# Altium schematic sheet Top-Sheet.SchDoc
size 420 x 297 mm; SheetNumber: 1; SheetTotal: 7
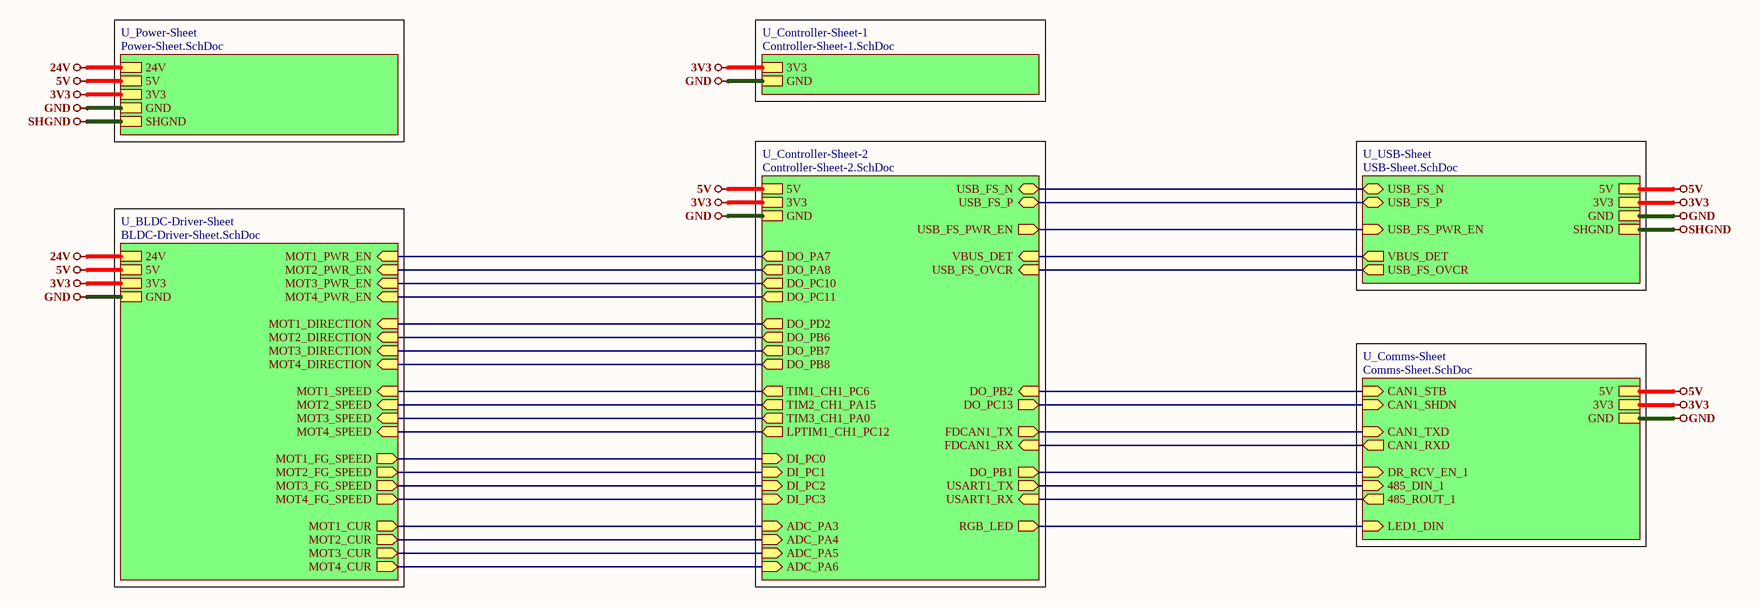
[diagram p0: Top-Sheet.SchDoc]

## Sub-sheets
U_BLDC-Driver-Sheet = BLDC-Driver-Sheet.SchDoc: GND, 3V3, 5V, 24V, MOT1_DIRECTION (in), MOT2_DIRECTION (in), MOT3_DIRECTION (in), MOT4_DIRECTION (in), MOT1_SPEED (in), MOT2_SPEED (in), MOT3_SPEED (in), MOT4_SPEED (in), MOT1_FG_SPEED (out), MOT2_FG_SPEED (out), MOT3_FG_SPEED (out), MOT4_FG_SPEED (out), MOT1_PWR_EN (in), MOT2_PWR_EN (in), MOT3_PWR_EN (in), MOT4_PWR_EN (in), MOT1_CUR (out), MOT2_CUR (out), MOT3_CUR (out), MOT4_CUR (out)
U_Comms-Sheet = Comms-Sheet.SchDoc: CAN1_STB (in), CAN1_TXD (in), CAN1_RXD (out), CAN1_SHDN (in), LED1_DIN (in), DR_RCV_EN_1 (in), 485_ROUT_1 (out), 485_DIN_1 (in), GND, 3V3, 5V
U_Controller-Sheet-1 = Controller-Sheet-1.SchDoc: GND, 3V3
U_Controller-Sheet-2 = Controller-Sheet-2.SchDoc: FDCAN1_RX (in), FDCAN1_TX (out), USB_FS_N (bidir), USB_FS_P (bidir), USB_FS_OVCR (in), GND, 3V3, 5V, VBUS_DET (in), USB_FS_PWR_EN (out), TIM3_CH1_PA0 (out), TIM2_CH1_PA15 (out), TIM1_CH1_PC6 (out), LPTIM1_CH1_PC12 (out), DI_PC0 (in), USART1_RX (in), USART1_TX (out), ADC_PA3 (in), DO_PA7 (out), DO_PA8 (out), DO_PB2 (in), DO_PB6 (out), DO_PD2 (out), DO_PC10 (out), DO_PC11 (out), DO_PC13 (out), RGB_LED (out), DO_PB1 (out), DO_PB7 (out), DO_PB8 (out), ADC_PA4 (in), ADC_PA5 (in), ADC_PA6 (in), DI_PC1 (in), DI_PC2 (in), DI_PC3 (in)
U_Power-Sheet = Power-Sheet.SchDoc: GND, 3V3, 5V, 24V, SHGND
U_USB-Sheet = USB-Sheet.SchDoc: USB_FS_N (bidir), USB_FS_P (bidir), VBUS_DET (out), USB_FS_PWR_EN (in), USB_FS_OVCR (out), GND, 3V3, 5V, SHGND

## Nets
3V3: sheet U_Power-Sheet/3V3, sheet U_USB-Sheet/3V3, sheet U_Comms-Sheet/3V3, sheet U_Controller-Sheet-1/3V3, sheet U_Controller-Sheet-2/3V3, sheet U_BLDC-Driver-Sheet/3V3
5V: sheet U_Power-Sheet/5V, sheet U_USB-Sheet/5V, sheet U_Comms-Sheet/5V, sheet U_Controller-Sheet-2/5V, sheet U_BLDC-Driver-Sheet/5V
24V: sheet U_Power-Sheet/24V, sheet U_BLDC-Driver-Sheet/24V
GND: sheet U_Power-Sheet/GND, sheet U_USB-Sheet/GND, sheet U_Comms-Sheet/GND, sheet U_Controller-Sheet-1/GND, sheet U_Controller-Sheet-2/GND, sheet U_BLDC-Driver-Sheet/GND
SHGND: sheet U_Power-Sheet/SHGND, sheet U_USB-Sheet/SHGND
(unnamed): sheet U_USB-Sheet/USB_FS_N, sheet U_Controller-Sheet-2/USB_FS_N
(unnamed): sheet U_USB-Sheet/USB_FS_P, sheet U_Controller-Sheet-2/USB_FS_P
(unnamed): sheet U_USB-Sheet/VBUS_DET, sheet U_Controller-Sheet-2/VBUS_DET
(unnamed): sheet U_USB-Sheet/USB_FS_PWR_EN, sheet U_Controller-Sheet-2/USB_FS_PWR_EN
(unnamed): sheet U_USB-Sheet/USB_FS_OVCR, sheet U_Controller-Sheet-2/USB_FS_OVCR
(unnamed): sheet U_Comms-Sheet/CAN1_STB, sheet U_Controller-Sheet-2/DO_PB2
(unnamed): sheet U_Comms-Sheet/CAN1_TXD, sheet U_Controller-Sheet-2/FDCAN1_TX
(unnamed): sheet U_Comms-Sheet/CAN1_RXD, sheet U_Controller-Sheet-2/FDCAN1_RX
(unnamed): sheet U_Comms-Sheet/CAN1_SHDN, sheet U_Controller-Sheet-2/DO_PC13
(unnamed): sheet U_Comms-Sheet/LED1_DIN, sheet U_Controller-Sheet-2/RGB_LED
(unnamed): sheet U_Comms-Sheet/DR_RCV_EN_1, sheet U_Controller-Sheet-2/DO_PB1
(unnamed): sheet U_Comms-Sheet/485_ROUT_1, sheet U_Controller-Sheet-2/USART1_RX
(unnamed): sheet U_Comms-Sheet/485_DIN_1, sheet U_Controller-Sheet-2/USART1_TX
(unnamed): sheet U_Controller-Sheet-2/TIM3_CH1_PA0, sheet U_BLDC-Driver-Sheet/MOT3_SPEED
(unnamed): sheet U_Controller-Sheet-2/TIM2_CH1_PA15, sheet U_BLDC-Driver-Sheet/MOT2_SPEED
(unnamed): sheet U_Controller-Sheet-2/TIM1_CH1_PC6, sheet U_BLDC-Driver-Sheet/MOT1_SPEED
(unnamed): sheet U_Controller-Sheet-2/LPTIM1_CH1_PC12, sheet U_BLDC-Driver-Sheet/MOT4_SPEED
(unnamed): sheet U_Controller-Sheet-2/DI_PC0, sheet U_BLDC-Driver-Sheet/MOT1_FG_SPEED
(unnamed): sheet U_Controller-Sheet-2/ADC_PA3, sheet U_BLDC-Driver-Sheet/MOT1_CUR
(unnamed): sheet U_Controller-Sheet-2/DO_PA7, sheet U_BLDC-Driver-Sheet/MOT1_PWR_EN
(unnamed): sheet U_Controller-Sheet-2/DO_PA8, sheet U_BLDC-Driver-Sheet/MOT2_PWR_EN
(unnamed): sheet U_Controller-Sheet-2/DO_PB6, sheet U_BLDC-Driver-Sheet/MOT2_DIRECTION
(unnamed): sheet U_Controller-Sheet-2/DO_PD2, sheet U_BLDC-Driver-Sheet/MOT1_DIRECTION
(unnamed): sheet U_Controller-Sheet-2/DO_PC10, sheet U_BLDC-Driver-Sheet/MOT3_PWR_EN
(unnamed): sheet U_Controller-Sheet-2/DO_PC11, sheet U_BLDC-Driver-Sheet/MOT4_PWR_EN
(unnamed): sheet U_Controller-Sheet-2/DO_PB7, sheet U_BLDC-Driver-Sheet/MOT3_DIRECTION
(unnamed): sheet U_Controller-Sheet-2/DO_PB8, sheet U_BLDC-Driver-Sheet/MOT4_DIRECTION
(unnamed): sheet U_Controller-Sheet-2/ADC_PA4, sheet U_BLDC-Driver-Sheet/MOT2_CUR
(unnamed): sheet U_Controller-Sheet-2/ADC_PA5, sheet U_BLDC-Driver-Sheet/MOT3_CUR
(unnamed): sheet U_Controller-Sheet-2/ADC_PA6, sheet U_BLDC-Driver-Sheet/MOT4_CUR
(unnamed): sheet U_Controller-Sheet-2/DI_PC1, sheet U_BLDC-Driver-Sheet/MOT2_FG_SPEED
(unnamed): sheet U_Controller-Sheet-2/DI_PC2, sheet U_BLDC-Driver-Sheet/MOT3_FG_SPEED
(unnamed): sheet U_Controller-Sheet-2/DI_PC3, sheet U_BLDC-Driver-Sheet/MOT4_FG_SPEED

## Notes on the sheet
- File:
- Title:
- Date:
- Page
- Num:
- Total:
- Drawn By: Huzaifa Ali